# Altium schematic sheet TOP.SchDoc: TOP
size A4; Revision: V2.0; SheetNumber: 1; SheetTotal: 7; Project: PY32F403v1xT_START
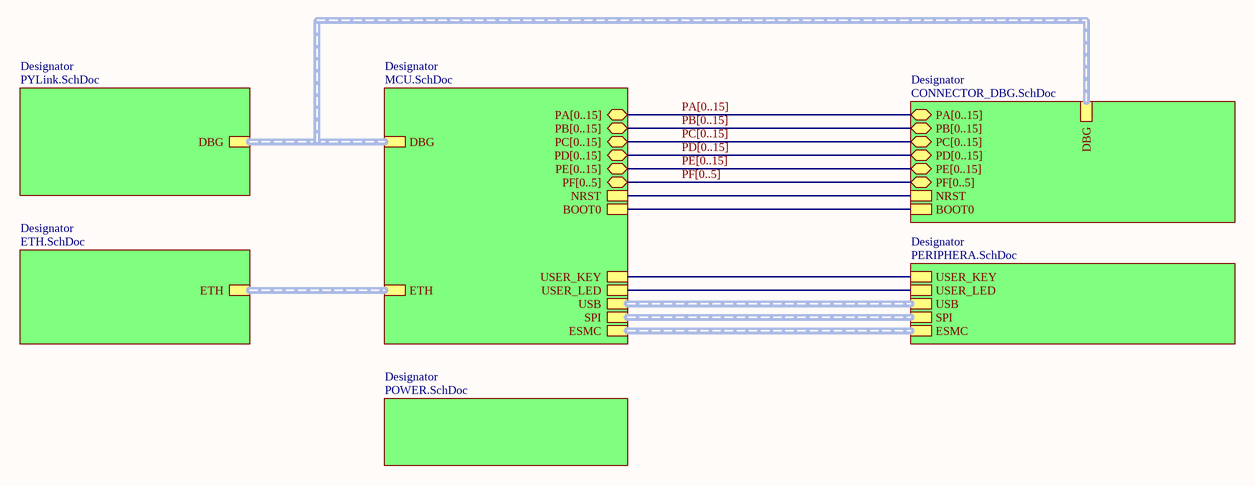
[diagram p0: TOP.SchDoc]

## Sub-sheets
Designator = PYLink.SchDoc: DBG (harness QSPI)
Designator = MCU.SchDoc: PA[0..15] (bidir), PB[0..15] (bidir), PC[0..15] (bidir), PD[0..15] (bidir), PE[0..15] (bidir), NRST, BOOT0, ETH (harness QSPI), USB (harness QSPI), ESMC (harness QSPI), SPI (harness QSPI), DBG (harness QSPI), PF[0..5] (bidir), USER_KEY, USER_LED
Designator = ETH.SchDoc: ETH (harness QSPI)
Designator = PERIPHERA.SchDoc: USB (harness QSPI), ESMC (harness QSPI), SPI (harness QSPI), USER_KEY, USER_LED
Designator = CONNECTOR_DBG.SchDoc: PA[0..15] (bidir), PB[0..15] (bidir), PC[0..15] (bidir), PD[0..15] (bidir), PE[0..15] (bidir), NRST, BOOT0, DBG (harness QSPI), PF[0..5] (bidir)
Designator = POWER.SchDoc: no entries

## Nets
(unnamed): sheet Designator/NRST, sheet Designator/NRST
(unnamed): sheet Designator/BOOT0, sheet Designator/BOOT0
(unnamed): sheet Designator/USER_KEY, sheet Designator/USER_KEY
(unnamed): sheet Designator/USER_LED, sheet Designator/USER_LED

## Buses and harness runs
bus PA[0..15] = sheet Designator/PA[0..15]
bus PB[0..15] = sheet Designator/PB[0..15]
bus PC[0..15] = sheet Designator/PC[0..15]
bus PD[0..15] = sheet Designator/PD[0..15]
bus PE[0..15] = sheet Designator/PE[0..15]
bus PF[0..5] = sheet Designator/PF[0..5]

## Notes on the sheet
- Title:
- Project:
- Size:
- Sheet:
- A4
- of
- Date:
- Revision: